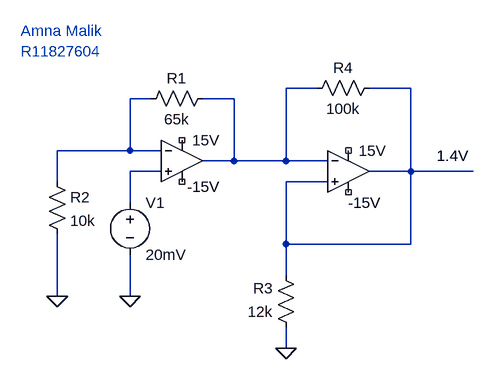
[diagram p0: schematic Project 1.asc]
Project 1.asc, the LTspice schematic file:
Version 4.1
SHEET 1 1280 680
WIRE 848 160 800 160
WIRE 992 160 928 160
WIRE 592 176 560 176
WIRE 720 176 672 176
WIRE 560 256 560 176
WIRE 560 256 448 256
WIRE 608 256 560 256
WIRE 720 272 720 176
WIRE 720 272 672 272
WIRE 800 272 800 160
WIRE 800 272 720 272
WIRE 864 272 800 272
WIRE 608 288 560 288
WIRE 992 288 992 160
WIRE 992 288 928 288
WIRE 1088 288 992 288
WIRE 448 304 448 256
WIRE 864 304 800 304
WIRE 560 336 560 288
WIRE 800 400 800 304
WIRE 992 400 992 288
WIRE 992 400 800 400
WIRE 800 448 800 400
WIRE 448 480 448 384
WIRE 560 480 560 416
WIRE 800 560 800 528
FLAG 448 480 0
FLAG 560 480 0
FLAG 800 560 0
SYMBOL res 816 544 R180
WINDOW 0 36 76 Left 2
WINDOW 3 36 40 Left 2
SYMATTR InstName R3
SYMATTR Value 12k
SYMBOL OpAmps\\UniversalOpAmp 640 272 R0
SYMATTR InstName 15V
SYMBOL OpAmps\\UniversalOpAmp 896 288 R0
SYMATTR InstName 15V
SYMBOL res 688 160 R90
WINDOW 0 0 56 VBottom 2
WINDOW 3 32 56 VTop 2
SYMATTR InstName R1
SYMATTR Value 65k
SYMBOL voltage 560 320 R0
SYMATTR InstName V1
SYMATTR Value 20mV
SYMBOL res 432 288 R0
SYMATTR InstName R2
SYMATTR Value 10k
SYMBOL res 944 144 R90
WINDOW 0 0 56 VBottom 2
WINDOW 3 32 56 VTop 2
SYMATTR InstName R4
SYMATTR Value 100k
TEXT 648 312 Left 2 !-15V
TEXT 896 336 Left 2 !-15V
TEXT 1032 264 Left 2 !1.4V
TEXT 392 72 Left 2 ;Amna Malik\nR11827604

The netlist it stands for:
* Project 1.asc
R3 0 N002 12k
X§15V N004 N003 NC_01 NC_02 N001 level1 Avol=1Meg GBW=10Meg Vos=0 En=0 Enk=0 In=0 Ink=0 Rin=500Meg  ; pins In+ In- V+ V- OUT
X§15V N002 N001 NC_03 NC_04 N002 level1 Avol=1Meg GBW=10Meg Vos=0 En=0 Enk=0 In=0 Ink=0 Rin=500Meg  ; pins In+ In- V+ V- OUT
R1 N001 N003 65k
V1 N004 0 20mV
R2 N003 0 10k
R4 N002 N001 100k
-15V
-15V
1.4V
* Amna Malik
* R11827604
.lib UniversalOpAmp1.lib
.backanno
.end